# Altium schematic sheet Power_Switch.SchDoc: Power_Switch
size A3; Organization: Altium Limited; Address1: L3, 12a Rodborough Rd; Address2: Frenchs Forest; Address3: NSW; Address4: Australia 2086
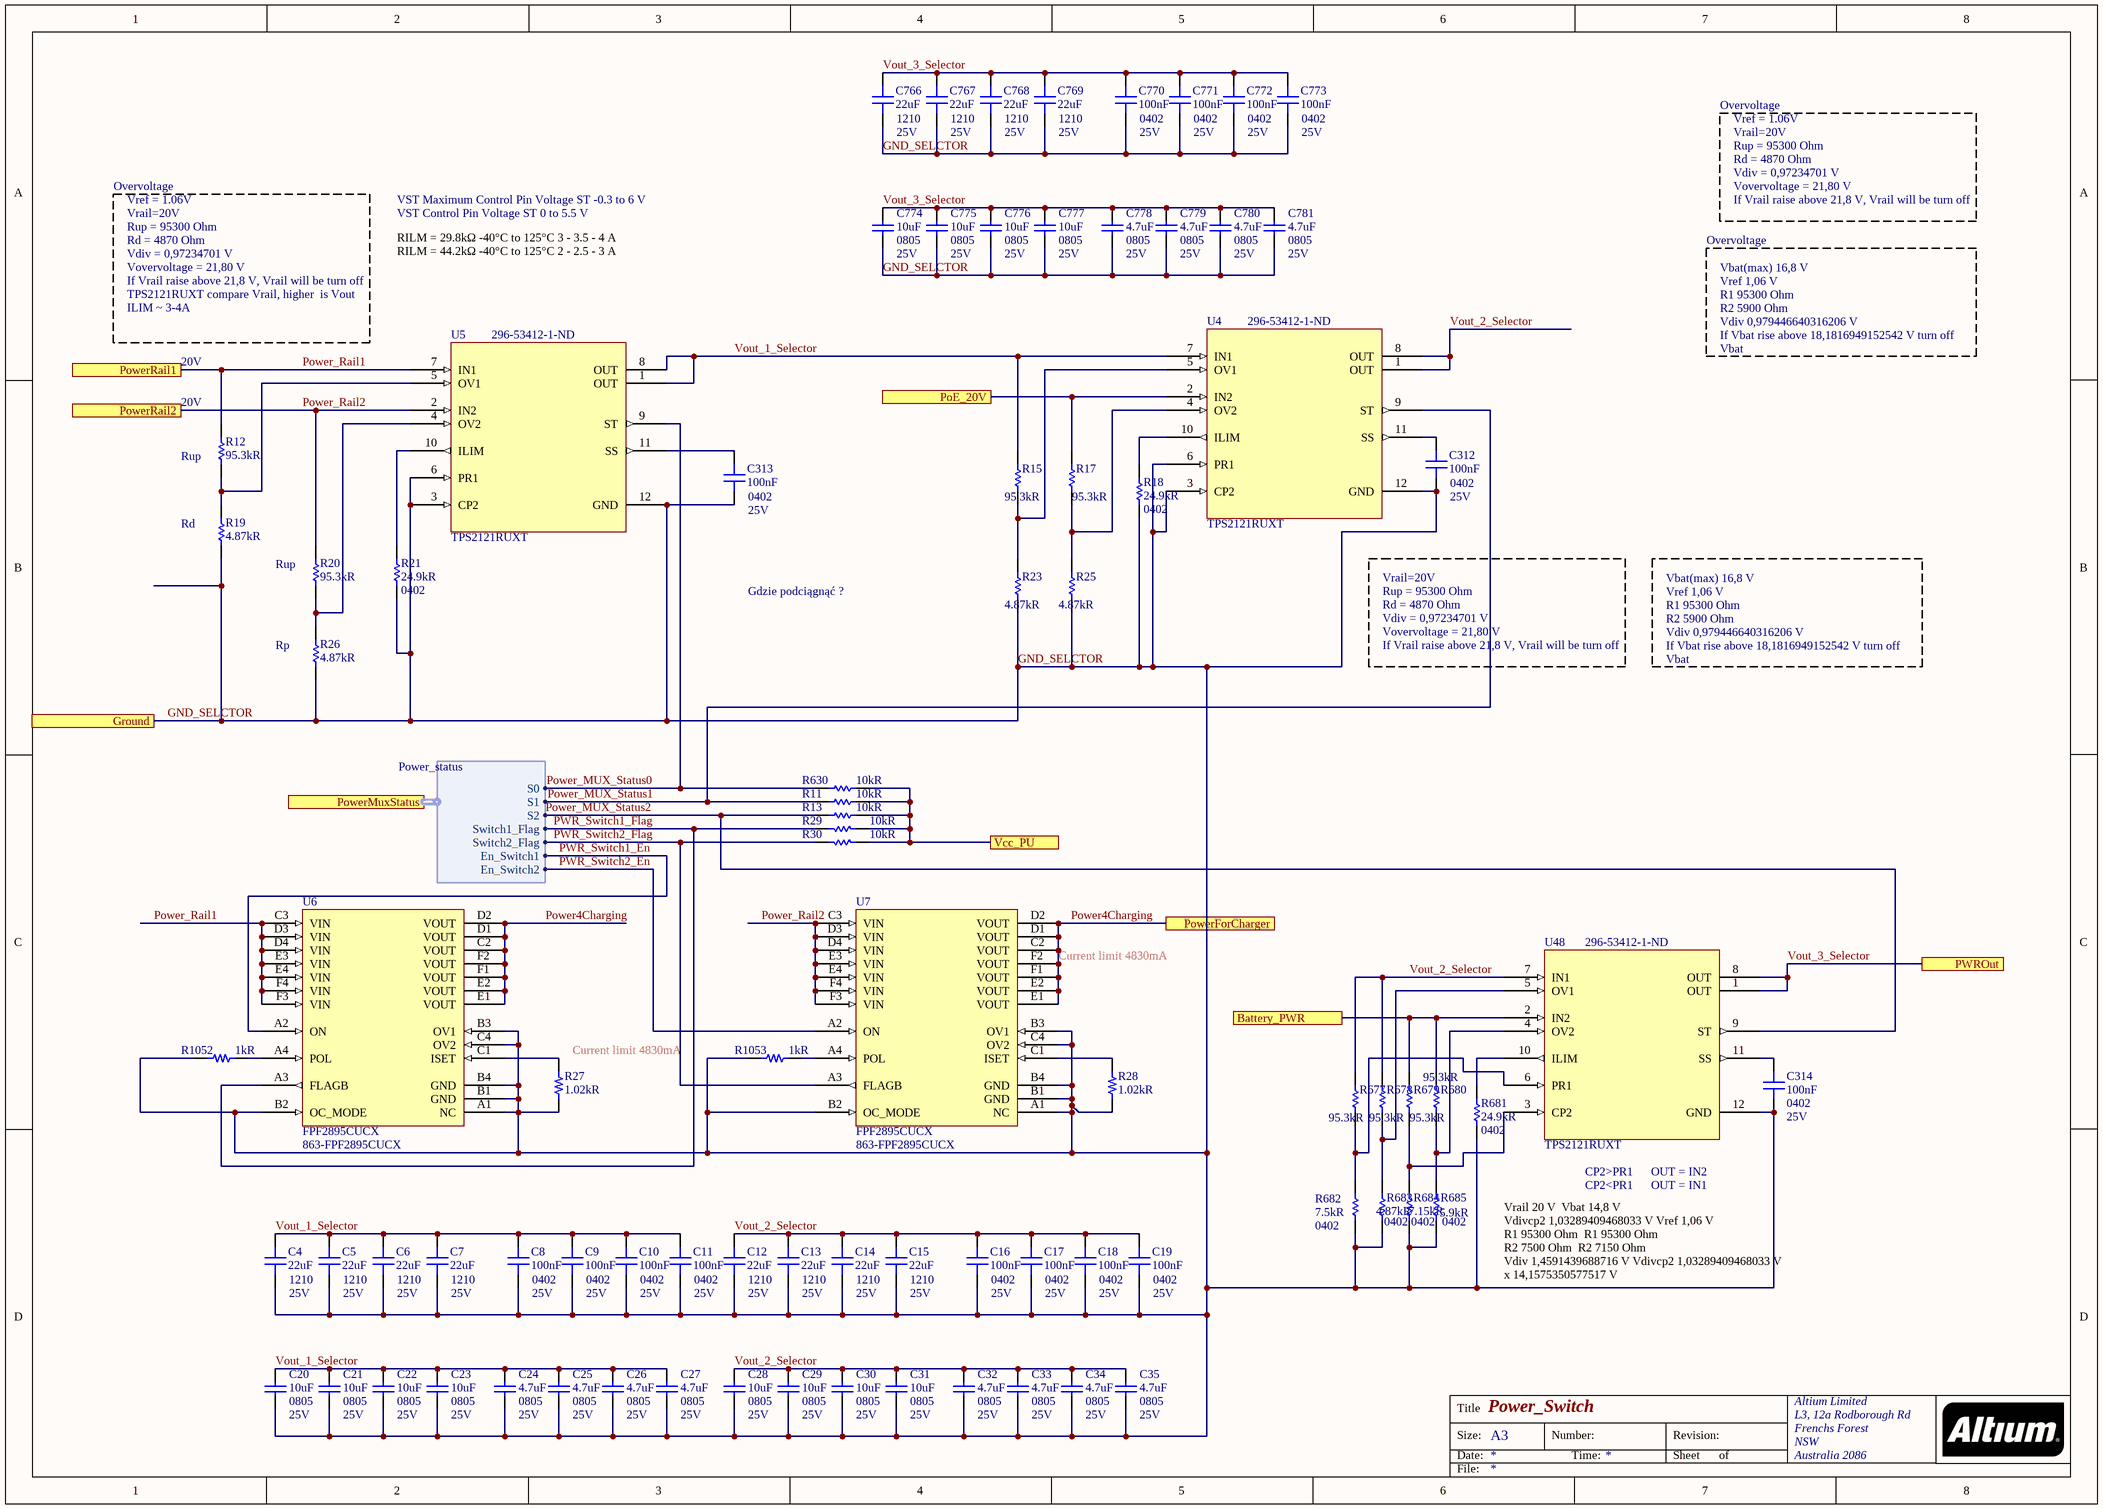
[diagram p0: Power_Switch.SchDoc]

## Parts
C4  22uF  Case/Package: 1210  Voltage Rating: 25V  [CAP 1210/3225 - 1MM]
C5  22uF  Case/Package: 1210  Voltage Rating: 25V  [CAP 1210/3225 - 1MM]
C6  22uF  Case/Package: 1210  Voltage Rating: 25V  [CAP 1210/3225 - 1MM]
C7  22uF  Case/Package: 1210  Voltage Rating: 25V  [CAP 1210/3225 - 1MM]
C8  100nF  Case/Package: 0402  Voltage Rating: 25V  [CAP 0402/1005 KK]
C9  100nF  Case/Package: 0402  Voltage Rating: 25V  [CAP 0402/1005 KK]
C10  100nF  Case/Package: 0402  Voltage Rating: 25V  [CAP 0402/1005 KK]
C11  100nF  Case/Package: 0402  Voltage Rating: 25V  [CAP 0402/1005 KK]
C12  22uF  Case/Package: 1210  Voltage Rating: 25V  [CAP 1210/3225 - 1MM]
C13  22uF  Case/Package: 1210  Voltage Rating: 25V  [CAP 1210/3225 - 1MM]
C14  22uF  Case/Package: 1210  Voltage Rating: 25V  [CAP 1210/3225 - 1MM]
C15  22uF  Case/Package: 1210  Voltage Rating: 25V  [CAP 1210/3225 - 1MM]
C16  100nF  Case/Package: 0402  Voltage Rating: 25V  [CAP 0402/1005 KK]
C17  100nF  Case/Package: 0402  Voltage Rating: 25V  [CAP 0402/1005 KK]
C18  100nF  Case/Package: 0402  Voltage Rating: 25V  [CAP 0402/1005 KK]
C19  100nF  Case/Package: 0402  Voltage Rating: 25V  [CAP 0402/1005 KK]
C20  10uF  Case/Package: 0805  Voltage Rating: 25V  [CAP 0805/2012 RF]
C21  10uF  Case/Package: 0805  Voltage Rating: 25V  [CAP 0805/2012 RF]
C22  10uF  Case/Package: 0805  Voltage Rating: 25V  [CAP 0805/2012 RF]
C23  10uF  Case/Package: 0805  Voltage Rating: 25V  [CAP 0805/2012 RF]
C24  4.7uF  Case/Package: 0805  Voltage Rating: 25V  [CAP 0805/2012 RF]
C25  4.7uF  Case/Package: 0805  Voltage Rating: 25V  [CAP 0805/2012 RF]
C26  4.7uF  Case/Package: 0805  Voltage Rating: 25V  [CAP 0805/2012 RF]
C27  4.7uF  Case/Package: 0805  Voltage Rating: 25V  [CAP 0805/2012 RF]
C28  10uF  Case/Package: 0805  Voltage Rating: 25V  [CAP 0805/2012 RF]
C29  10uF  Case/Package: 0805  Voltage Rating: 25V  [CAP 0805/2012 RF]
C30  10uF  Case/Package: 0805  Voltage Rating: 25V  [CAP 0805/2012 RF]
C31  10uF  Case/Package: 0805  Voltage Rating: 25V  [CAP 0805/2012 RF]
C32  4.7uF  Case/Package: 0805  Voltage Rating: 25V  [CAP 0805/2012 RF]
C33  4.7uF  Case/Package: 0805  Voltage Rating: 25V  [CAP 0805/2012 RF]
C34  4.7uF  Case/Package: 0805  Voltage Rating: 25V  [CAP 0805/2012 RF]
C35  4.7uF  Case/Package: 0805  Voltage Rating: 25V  [CAP 0805/2012 RF]
C312  100nF  Case/Package: 0402  Voltage Rating: 25V  [CAP 0402/1005 KK]
C313  100nF  Case/Package: 0402  Voltage Rating: 25V  [CAP 0402/1005 KK]
C314  100nF  Case/Package: 0402  Voltage Rating: 25V  [CAP 0402/1005 KK]
C766  22uF  Case/Package: 1210  Voltage Rating: 25V  [CAP 1210/3225 - 1MM]
C767  22uF  Case/Package: 1210  Voltage Rating: 25V  [CAP 1210/3225 - 1MM]
C768  22uF  Case/Package: 1210  Voltage Rating: 25V  [CAP 1210/3225 - 1MM]
C769  22uF  Case/Package: 1210  Voltage Rating: 25V  [CAP 1210/3225 - 1MM]
C770  100nF  Case/Package: 0402  Voltage Rating: 25V  [CAP 0402/1005 KK]
C771  100nF  Case/Package: 0402  Voltage Rating: 25V  [CAP 0402/1005 KK]
C772  100nF  Case/Package: 0402  Voltage Rating: 25V  [CAP 0402/1005 KK]
C773  100nF  Case/Package: 0402  Voltage Rating: 25V  [CAP 0402/1005 KK]
C774  10uF  Case/Package: 0805  Voltage Rating: 25V  [CAP 0805/2012 RF]
C775  10uF  Case/Package: 0805  Voltage Rating: 25V  [CAP 0805/2012 RF]
C776  10uF  Case/Package: 0805  Voltage Rating: 25V  [CAP 0805/2012 RF]
C777  10uF  Case/Package: 0805  Voltage Rating: 25V  [CAP 0805/2012 RF]
C778  4.7uF  Case/Package: 0805  Voltage Rating: 25V  [CAP 0805/2012 RF]
C779  4.7uF  Case/Package: 0805  Voltage Rating: 25V  [CAP 0805/2012 RF]
C780  4.7uF  Case/Package: 0805  Voltage Rating: 25V  [CAP 0805/2012 RF]
C781  4.7uF  Case/Package: 0805  Voltage Rating: 25V  [CAP 0805/2012 RF]
R11  10kR  [RES 0402/1005 RF KK]
R12  95.3kR  [RES 0402/1005 RF KK]
R13  10kR  [RES 0402/1005 RF KK]
R15  95.3kR  [RES 0402/1005 RF KK]
R17  95.3kR  [RES 0402/1005 RF KK]
R18  24.9kR  Case/Package: 0402  [RES 0402/1005 RF KK]
R19  4.87kR  [RES 0402/1005 RF KK]
R20  95.3kR  [RES 0402/1005 RF KK]
R21  24.9kR  Case/Package: 0402  [RES 0402/1005 RF KK]
R23  4.87kR  [RES 0402/1005 RF KK]
R25  4.87kR  [RES 0402/1005 RF KK]
R26  4.87kR  [RES 0402/1005 RF KK]
R27  1.02kR  [RES 0402/1005 RF KK]
R28  1.02kR  [RES 0402/1005 RF KK]
R29  10kR  [RES 0402/1005 RF KK]
R30  10kR  [RES 0402/1005 RF KK]
R630  10kR  [RES 0402/1005 RF KK]
R677  95.3kR  [RES 0402/1005 RF KK]
R678  95.3kR  [RES 0402/1005 RF KK]
R679  95.3kR  [RES 0402/1005 RF KK]
R680  95.3kR  [RES 0402/1005 RF KK]
R681  24.9kR  Case/Package: 0402  [RES 0402/1005 RF KK]
R682  7.5kR  Case Code (Imperial): 0402  [RES 0402/1005 RF KK]
R683  4.87kR  Case/Package: 0402  [RES 0402/1005 RF KK]
R684  7.15kR  Case/Package: 0402  [RES 0402/1005 RF KK]
R685  5.9kR  Case Code (Imperial): 0402  [RES 0402/1005 RF KK]
R1052  1kR  [RES 0402/1005 RF KK]
R1053  1kR  [RES 0402/1005 RF KK]
U4  TPS2121RUXT  Supplier Part Number 1: 296-53412-1-ND  [TPS212x]
U5  TPS2121RUXT  Supplier Part Number 1: 296-53412-1-ND  [TPS212x]
U6  FPF2895CUCX  Supplier Part Number 1: 863-FPF2895CUCX  [FPF2895C-D]
U7  FPF2895CUCX  Supplier Part Number 1: 863-FPF2895CUCX  [FPF2895C-D]
U48  TPS2121RUXT  Supplier Part Number 1: 296-53412-1-ND  [TPS212x]

## Ports
Battery_PWR, Ground, PoE_20V, PowerForCharger, PowerMuxStatus (harness Power_status), PowerRail1, PowerRail2, PWROut, Vcc_PU

## Harnesses
Power_status: S0, S1, Switch1_Flag, Switch2_Flag, En_Switch1, En_Switch2, S2

## Nets
Battery_PWR: R679.2 R680.2 U48.2(IN2) ; port Battery_PWR
GND_SELCTOR: C4.2 C5.2 C6.2 C7.2 C8.1 C9.1 C10.1 C11.1 C12.2 C13.2 C14.2 C15.2 C16.1 C17.1 C18.1 C19.1 C20.1 C21.1 C22.1 C23.1 C24.1 C25.1 C26.1 C27.1 C28.1 C29.1 C30.1 C31.1 C32.1 C33.1 C34.1 C35.1 C312.1 C313.1 C314.2 C766.2 C767.2 C768.2 C769.2 C770.1 C771.1 C772.1 C773.1 C774.1 C775.1 C776.1 C777.1 C778.1 C779.1 C780.1 C781.1 R18.1 R19.1 R21.1 R23.1 R25.1 R26.1 R27.1 R28.2 R681.1 R682.1 R683.1 R684.1 R685.1 R1052.2 R1053.2 U4.3(CP2) U4.6(PR1) U4.12(GND) U5.3(CP2) U5.6(PR1) U5.12(GND) U6.A1(NC) U6.B1(GND) U6.B2(OC_MODE) U6.B3(OV1) U6.B4(GND) U6.C4(OV2) U7.A1(NC) U7.B1(GND) U7.B2(OC_MODE) U7.B3(OV1) U7.B4(GND) U7.C4(OV2) U48.12(GND) ; port Ground
PoE_20V: R17.2 U4.2(IN2) ; port PoE_20V
Power4Charging: U6.C2(VOUT) U6.D1(VOUT) U6.D2(VOUT) U6.E1(VOUT) U6.E2(VOUT) U6.F1(VOUT) U6.F2(VOUT) U7.C2(VOUT) U7.D1(VOUT) U7.D2(VOUT) U7.E1(VOUT) U7.E2(VOUT) U7.F1(VOUT) U7.F2(VOUT) ; port PowerForCharger
Power_MUX_Status0: R630.2 U5.9(ST) ; port PowerMuxStatus.S0
Power_MUX_Status1: R11.1 U4.9(ST) ; port PowerMuxStatus.S1
Power_MUX_Status2: R13.2 U48.9(ST) ; port PowerMuxStatus.S2
Power_Rail1: R12.2 U5.7(IN1) U6.C3(VIN) U6.D3(VIN) U6.D4(VIN) U6.E3(VIN) U6.E4(VIN) U6.F3(VIN) U6.F4(VIN) ; port PowerRail1
Power_Rail2: R20.2 U5.2(IN2) U7.C3(VIN) U7.D3(VIN) U7.D4(VIN) U7.E3(VIN) U7.E4(VIN) U7.F3(VIN) U7.F4(VIN) ; port PowerRail2
PWR_Switch1_En: U6.A2(ON) ; port PowerMuxStatus.En_Switch1
PWR_Switch1_Flag: R29.1 U6.A3(FLAGB) ; port PowerMuxStatus.Switch1_Flag
PWR_Switch2_En: U7.A2(ON) ; port PowerMuxStatus.En_Switch2
PWR_Switch2_Flag: R30.1 U7.A3(FLAGB) ; port PowerMuxStatus.Switch2_Flag
Vcc_PU: R11.2 R13.1 R29.2 R30.2 R630.1 ; port Vcc_PU
Vout_1_Selector: C4.1 C5.1 C6.1 C7.1 C8.2 C9.2 C10.2 C11.2 C20.2 C21.2 C22.2 C23.2 C24.2 C25.2 C26.2 C27.2 R15.2 U4.7(IN1) U5.1(OUT) U5.8(OUT)
Vout_2_Selector: C12.1 C13.1 C14.1 C15.1 C16.2 C17.2 C18.2 C19.2 C28.2 C29.2 C30.2 C31.2 C32.2 C33.2 C34.2 C35.2 R677.2 R678.2 U4.1(OUT) U4.8(OUT) U48.7(IN1)
Vout_3_Selector: C766.1 C767.1 C768.1 C769.1 C770.2 C771.2 C772.2 C773.2 C774.2 C775.2 C776.2 C777.2 C778.2 C779.2 C780.2 C781.2 U48.1(OUT) U48.8(OUT) ; port PWROut
NetC312_2: C312.2 U4.11(SS)
NetC313_2: C313.2 U5.11(SS)
NetC314_1: C314.1 U48.11(SS)
NetR12_1: R12.1 R19.2 U5.5(OV1)
NetR15_1: R15.1 R23.2 U4.5(OV1)
NetR17_1: R17.1 R25.2 U4.4(OV2)
NetR18_2: R18.2 U4.10(ILIM)
NetR20_1: R20.1 R26.2 U5.4(OV2)
NetR21_2: R21.2 U5.10(ILIM)
NetR27_2: R27.2 U6.C1(ISET)
NetR28_1: R28.1 U7.C1(ISET)
NetR677_1: R677.1 R682.2 U48.6(PR1)
NetR678_1: R678.1 R683.2 U48.5(OV1)
NetR679_1: R679.1 R684.2 U48.3(CP2)
NetR680_1: R680.1 R685.2 U48.4(OV2)
NetR681_2: R681.2 U48.10(ILIM)
NetR1052_1: R1052.1 U6.A4(POL)
NetR1053_1: R1053.1 U7.A4(POL)

## Notes on the sheet
- Overvoltage
- Vref = 1.06V
- Vrail=20V
- Rup = 95300 Ohm
- Rd = 4870 Ohm
- Vdiv = 0,97234701 V
- VST Maximum Control Pin Voltage ST -0.3 to 6 V
- VST Control Pin Voltage ST 0 to 5.5 V
- Vovervoltage = 21,80 V
- If Vrail raise above 21,8 V, Vrail will be turn off
- TPS2121RUXT compare Vrail, higher  is Vout
- ILIM ~ 3-4A
- RILM = 29.8kΩ -40°C to 125°C 3 - 3.5 - 4 A
  RILM = 44.2kΩ -40°C to 125°C 2 - 2.5 - 3 A
- 20V
- Vbat(max)	16,8	V
  Vref	1,06	V
  R1	95300	Ohm
  R2	5900	Ohm
  Vdiv	0,979446640316206	V
  If Vbat rise above 18,1816949152542 V turn off Vbat
- (near R12) 20V
- (near R12) Rup
- (near R19) Rd
- (near R20) Rup
- (near R26) Rp
- Gdzie podciągnąć ?
- (near U7) Current limit 4830mA
- (near R27) Current limit 4830mA
- CP2>PR1      OUT = IN2
- CP2<PR1      OUT = IN1
- Vrail	20	V		Vbat	14,8	V
  Vdivcp2	1,03289409468033	V	Vref	1,06	V
  R1	95300	Ohm		R1	95300	Ohm
  R2	7500	Ohm		R2	7150	Ohm
  Vdiv	1,4591439688716	V	Vdivcp2	1,03289409468033	V
  x	14,1575350577517	V
- Title
- Size:
- Date:
- A3
- Number:
- Time:
- Revision:
- Sheet
- of
- File:

## Library data of the parts
C4-C7 C12-C15 C766-C769 = Capacitor: Manufacturer: Samsung; Manufacturer Part Number: CL32A226KAJNNNE; Material: Ceramic; Tolerance: 10%; Dielectric: X5R; Supplier 1: Digi-Key; Supplier Part Number 1: 1276-1101-1-ND; Stock 1: 46396; Pricing 1: 1 = 0,51000, 10 = 0,36300, 100 = 0,23920, 500 = 0,17722 (USD); RoHS: Yes; Mount: Surface Mount; Case Code (Metric): 3225; Case Code (Imperial): 1210; Contact Plating: Tin; Min Operating Temperature: -55°C; Max Operating Temperature: 85°C; Capacitance: 22uF; Packaging: Tape and Reel; Package Quantity: 1; Voltage: 25V; Length: 3.2mm; Height: 2.5mm; Width: 0.098inch; Thickness: 0.106inch; Depth: 2.5mm; Radiation Hardening: No; ComponentLink1URL: https://datasheet.ciiva.com/26947/getdatasheetpartid-358377-26947025.pdf?src-supplier=Verical; ComponentLink1Description: https://datasheet.ciiva.com/26947/getdatasheetpartid-358377-26947025.pdf?src-supplier=Verical; ComponentLink2URL: https://datasheet.ciiva.com/16202/cl32a226kajnnne-16202745.pdf?src-supplier=Future+Electronics; ComponentLink2Description: https://datasheet.ciiva.com/16202/cl32a226kajnnne-16202745.pdf?src-supplier=Future+Electronics; ComponentLink3URL: https://datasheet.ciiva.com/29241/450711-da-01-en-vs-kondensator-1210-29241799.pdf?src-supplier=Conrad; ComponentLink3Description: https://datasheet.ciiva.com/29241/450711-da-01-en-vs-kondensator-1210-29241799.pdf?src-supplier=Conrad
C8-C11 C16-C19 C312-C314 C770-C773 = Capacitor: Manufacturer: Murata; Manufacturer Part Number: GRM155R71E104KE14J; Tolerance: 10%; Dielectric: X7R; Supplier 1: Digi-Key; Supplier Part Number 1: 490-14603-1-ND; Stock 1: 89275; Pricing 1: 1 = 0,10000, 10 = 0,03400, 100 = 0,01520, 500 = 0,01088, 1000 = 0,00855, 2500 = 0,00778, 5000 = 0,00715 (USD); RoHS: Yes; Mount: Surface Mount; Weight: 0.000212oz; Case Code (Imperial): 0402; Case Code (Metric): 1005; Min Operating Temperature: -55°C; Max Operating Temperature: 125°C; Packaging: Tape and Reel; Capacitance: 100nF; Termination: SMD/SMT; Composition: Ceramic; Voltage Rating (DC): 25V; Package Quantity: 50000; Length: 0.039inch; Height: 0.5mm; Width: 0.5mm; Thickness: 0.022inch; ComponentLink1URL: http://www.mouser.com/ds/2/281/c02e-2905.pdf?src-supplier=Mouser; ComponentLink1Description: http://www.mouser.com/ds/2/281/c02e-2905.pdf?src-supplier=Mouser; ComponentLink2URL: http://search.murata.co.jp/Ceramy/image/img/A01X/G101/ENG/GRM155R71E104KE14-01.pdf?src-supplier=Digi-Key; ComponentLink2Description: http://search.murata.co.jp/Ceramy/image/img/A01X/G101/ENG/GRM155R71E104KE14-01.pdf?src-supplier=Digi-Key
C20-C23 C28-C31 C774-C777 = Capacitor: CAP CER 10UF 25V X5R 0805; Manufacturer: KEMET; Manufacturer Part Number: C0805C106K3PACTU; Dielectric Material: Ceramic; Dissipation Factor: 10%; Supplier 1: Digi-Key; Supplier Part Number 1: 399-11939-6-ND; RoHS: Yes; Category: Ceramic Capacitors; Stock 1: 4800; Pricing 1: 1=0,24000, 10=0,16800, 100=0,09510, 500=0,06710, 1000=0,05872 (USD); Mount: Surface Mount; Case Code (Metric): 2012; Case Code (Imperial): 0805; Min Operating Temperature: -55°C; Max Operating Temperature: 85°C; Dielectric: X5R; Packaging: Cut Tape; Voltage: 25V; Termination: Solder; Tolerance: 10%; Voltage Rating (DC): 25V; Capacitance: 10uF; Length: 0.079inch; Height: 1.25mm; Depth: 1.25mm; Width: 0.049inch; Thickness: 0.057inch; REACH SVHC: No SVHC; Lead Free: Lead Free; ComponentLink1URL: http://www.farnell.com/datasheets/2741185.pdf?src-supplier=Farnell; ComponentLink1Description: http://www.farnell.com/datasheets/2741185.pdf?src-supplier=Farnell; ComponentLink2URL: http://www.farnell.com/datasheets/2112054.pdf?src-supplier=Farnell; ComponentLink2Description: http://www.farnell.com/datasheets/2112054.pdf?src-supplier=Farnell; ComponentLink3URL: http://www.alliedelec.com/m/d/f3c02ddb98afa3dd1adcb801109671e9.pdf?src-supplier=Allied+Electronics; ComponentLink3Description: http://www.alliedelec.com/m/d/f3c02ddb98afa3dd1adcb801109671e9.pdf?src-supplier=Allied+Electronics; ComponentLink4URL: http://www.farnell.com/datasheets/2112054.pdf?src-supplier=Element14; ComponentLink4Description: http://www.farnell.com/datasheets/2112054.pdf?src-supplier=Element14; ComponentLink5URL: https://api.kemet.com/component-edge/download/datasheet/C0805C106K3PAC7800.pdf?src-supplier=Digi-Key; ComponentLink5Description: https://api.kemet.com/component-edge/download/datasheet/C0805C106K3PAC7800.pdf?src-supplier=Digi-Key; ComponentLink6URL: http://www.kemet.com/docfinder?Partnumber=C0805C106K3PAC7800&src-supplier=Digi-Key; ComponentLink6Description: http://www.kemet.com/docfinder?Partnumber=C0805C106K3PAC7800&src-supplier=Digi-Key; ComponentLink7URL: http://www.kemet.com/Lists/ProductCatalog/Attachments/19/KEM_C1006_X5R_SMD.pdf?src-supplier=Avnet; ComponentLink7Description: http://www.kemet.com/Lists/ProductCatalog/Attachments/19/KEM_C1006_X5R_SMD.pdf?src-supplier=Avnet
C24-C27 C32-C35 C778-C781 = Capacitor: CAP CER 4.7UF 25V X5R 0805; Manufacturer: Murata; Manufacturer Part Number: GRM219R61E475KA73D; Material: Ceramic; Tolerance: 10%; Supplier 1: Digi-Key; Supplier Part Number 1: 490-12753-1-ND; RoHS: Yes; Category: Ceramic Capacitors; Stock 1: 21355; Pricing 1: 1=0,30000, 10=0,20500, 100=0,11610, 500=0,08198, 1000=0,07173 (USD); Mount: Surface Mount; Weight: 0.000335oz; Case Code (Metric): 2012; Case Code (Imperial): 0805; Min Operating Temperature: -55°C; Max Operating Temperature: 85°C; Dielectric: X5R; Capacitance: 4.7uF; Packaging: Tape and Reel; Termination: SMD/SMT; Composition: Ceramic; Voltage Rating (DC): 25V; Package Quantity: 4000; Length: 2mm; Height: 0.85mm; Width: 1.25mm; Thickness: 0.037inch; ComponentLink1URL: http://www.mouser.com/ds/2/281/c02e-2905.pdf?src-supplier=Mouser; ComponentLink1Description: http://www.mouser.com/ds/2/281/c02e-2905.pdf?src-supplier=Mouser; ComponentLink2URL: http://search.murata.co.jp/Ceramy/image/img/A01X/partnumbering_e_01.pdf?src-supplier=Digi-Key; ComponentLink2Description: http://search.murata.co.jp/Ceramy/image/img/A01X/partnumbering_e_01.pdf?src-supplier=Digi-Key; ComponentLink3URL: http://search.murata.co.jp/Ceramy/image/img/A01X/G101/ENG/GRM219R61E475KA73-01.pdf?src-supplier=Digi-Key; ComponentLink3Description: http://search.murata.co.jp/Ceramy/image/img/A01X/G101/ENG/GRM219R61E475KA73-01.pdf?src-supplier=Digi-Key
R11 R13 R29 R30 R630 = Resistor: Manufacturer 1: Yageo; Manufacturer Part Number 1: RC0402FR-0710KL; Tolerance: 1%; Temperature Coefficient: 100ppm/°C; Voltage Rating: 50V; Power Rating: 62.5mW; Supplier 1: Digi-Key; Supplier Part Number 1: 311-10.0KLRCT-ND; Stock 1: 71214322; Pricing 1: 1=0,10000, 10=0,01500, 100=0,00600, 1000=0,00270, 2500=0,00235, 5000=0,00194 (USD); RoHS: Yes; Case/Package: 0402; Number of Pins: 2; Case Code (Imperial): 0402; Case Code (Metric): 1005; Min Operating Temperature: -55°C; Max Operating Temperature: 155°C; Resistance: 10kR; Packaging: Tape and Reel; Composition: Thick Film; Voltage Rating (DC): 50V; Termination: SMD/SMT; Military Standard: Not; Working Voltage: 50V; Number of Terminations: 2; Length: 1mm; Height: 0.32mm; Width: 0.5mm; Depth: 0.5mm; Lead Pitch: 0.2mm; REACH SVHC: No SVHC; Lead Free: Lead Free; ComponentLink1URL: https://datasheet.ciiva.com/7660/38568-7660787.pdf?src-supplier=Element14; ComponentLink1Description: https://datasheet.ciiva.com/7660/38568-7660787.pdf?src-supplier=Element14; ComponentLink2URL: https://datasheet.ciiva.com/7849/1784430-7849813.pdf?src-supplier=Element14; ComponentLink2Description: https://datasheet.ciiva.com/7849/1784430-7849813.pdf?src-supplier=Element14; ComponentLink3URL: https://datasheet.ciiva.com/7849/1686128-7849814.pdf?src-supplier=Element14; ComponentLink3Description: https://datasheet.ciiva.com/7849/1686128-7849814.pdf?src-supplier=Element14; ComponentLink4URL: https://datasheet.ciiva.com/7849/1784430-7849815.pdf?src-supplier=Element14; ComponentLink4Description: https://datasheet.ciiva.com/7849/1784430-7849815.pdf?src-supplier=Element14; ComponentLink5URL: https://datasheet.ciiva.com/22747/1018594-22747512.pdf?src-supplier=Element14; ComponentLink5Description: https://datasheet.ciiva.com/22747/1018594-22747512.pdf?src-supplier=Element14; ComponentLink6URL: https://datasheet.ciiva.com/12667/pyu-rc0402-51-rohs-l-6-r-12667067.pdf?src-supplier=Mouser; ComponentLink6Description: https://datasheet.ciiva.com/12667/pyu-rc0402-51-rohs-l-6-r-12667067.pdf?src-supplier=Mouser; ComponentLink7URL: https://datasheet.ciiva.com/7983/1018594-7983486.pdf?src-supplier=Element14; ComponentLink7Description: https://datasheet.ciiva.com/7983/1018594-7983486.pdf?src-supplier=Element14
R12 R15 R17 R20 R677-R680 = Resistor: Manufacturer 1: Yageo; Manufacturer Part Number 1: RC0402FR-0795K3L; Tolerance: 1%; Voltage Rating (DC): 50V; Power Rating: 62.5mW; Temperature Coefficient: 100ppm/°C; Max Power Dissipation: 63mW; Supplier 1: Digi-Key; Supplier Part Number 1: 311-95.3KLRCT-ND; Stock 1: 128730; Pricing 1: 1=0,10000, 10=0,01600, 100=0,00640, 1000=0,00289, 2500=0,00251, 5000=0,00207 (USD); RoHS: Yes; Case/Package: 0402; Case Code (Imperial): 0402; Case Code (Metric): 1005; Contact Plating: Tin,Matte; Min Operating Temperature: -55°C; Max Operating Temperature: 155°C; Resistance: 95.3kR; Packaging: Tape and Reel; Voltage Rating: 50V; Package Quantity: 1; Termination: SMD/SMT; Composition: Thick Film; Military Standard: Not; Features: Moisture Resistant; Number of Terminations: 2; Length: 0.039inch; Height: 0.016inch; Width: 0.02inch; Depth: 0.5mm; Lead Free: Lead Free; ComponentLink1URL: https://datasheet.ciiva.com/2453/pyu-r-int-thick-7-2453484.pdf?src-supplier=Digi-Key; ComponentLink1Description: https://datasheet.ciiva.com/2453/pyu-r-int-thick-7-2453484.pdf?src-supplier=Digi-Key; ComponentLink2URL: https://datasheet.ciiva.com/28395/pyu-rc0402-51-rohs-l-6-28395740.pdf?src-supplier=Avnet+Europe; ComponentLink2Description: https://datasheet.ciiva.com/28395/pyu-rc0402-51-rohs-l-6-28395740.pdf?src-supplier=Avnet+Europe; ComponentLink3URL: https://datasheet.ciiva.com/2453/pyu-r-int-thick-7-2453485.pdf?src-supplier=Digi-Key; ComponentLink3Description: https://datasheet.ciiva.com/2453/pyu-r-int-thick-7-2453485.pdf?src-supplier=Digi-Key; ComponentLink4URL: https://datasheet.ciiva.com/2453/pyu-r-int-thick-7-2453486.pdf?src-supplier=Digi-Key; ComponentLink4Description: https://datasheet.ciiva.com/2453/pyu-r-int-thick-7-2453486.pdf?src-supplier=Digi-Key; ComponentLink5URL: https://datasheet.ciiva.com/16746/pyu-rc0402-51-rohs-l-6-r-16746015.pdf?src-supplier=Future+Electronics; ComponentLink5Description: https://datasheet.ciiva.com/16746/pyu-rc0402-51-rohs-l-6-r-16746015.pdf?src-supplier=Future+Electronics
R18 R21 R681 = Resistor: RES SMD 24.9KOHM 0.1% 1/16W 0402; Manufacturer: Panasonic; Manufacturer Part Number: ERA-2AEB2492X; Power Rating: 63mW; Voltage Rating: 25V; Temperature Coefficient: 25ppm/°C; Voltage Rating (DC): 50V; Supplier 1: Digi-Key; Supplier Part Number 1: P24.9KDCCT-ND; RoHS: Yes; Category: Chip SMD Resistors; Stock 1: 58145; Pricing 1: 1=0,45000, 10=0,32100, 100=0,12830, 1000=0,06322, 2500=0,05858, 5000=0,05300 (USD); Mount: Surface Mount; Case Code (Metric): 1005; Case Code (Imperial): 0402; Contact Plating: Tin; Min Operating Temperature: -55°C; Max Operating Temperature: 155°C; Resistance: 24.9kR; Packaging: Tape and Reel; Tolerance: 0.1%; Package Quantity: 1; Composition: Thin Film,Metal Film; Number of Terminations: 2; Military Standard: Not; Max Power Dissipation: 63mW; Features: Automotive AEC-Q200; Termination: Wraparound; Length: 1mm; Height: 0.016inch; Width: 0.02inch; Depth: 0.5mm; REACH SVHC: Unknown; Lead Free: Lead Free; ComponentLink1URL: http://www.farnell.com/datasheets/2052875.pdf?src-supplier=Farnell; ComponentLink1Description: http://www.farnell.com/datasheets/2052875.pdf?src-supplier=Farnell; ComponentLink2URL: http://components.arrow.com/part/dataview/0323_02931773?src-supplier=Arrow+Europe; ComponentLink2Description: http://components.arrow.com/part/dataview/0323_02931773?src-supplier=Arrow+Europe; ComponentLink3URL: http://www.mouser.com/ds/2/315/AOA0000C237-1100991.pdf?src-supplier=Mouser; ComponentLink3Description: http://www.mouser.com/ds/2/315/AOA0000C237-1100991.pdf?src-supplier=Mouser; ComponentLink4URL: http://industrial.panasonic.com/www-data/pdf/AOA0000/AOA0000CE26.pdf?src-supplier=Avnet+Asia; ComponentLink4Description: http://industrial.panasonic.com/www-data/pdf/AOA0000/AOA0000CE26.pdf?src-supplier=Avnet+Asia; ComponentLink5URL: http://www.onlinecomponents.com/datasheet/era-2aeb2492x.aspx?p=44473673&src-supplier=Onlinecomponents.com; ComponentLink5Description: http://www.onlinecomponents.com/datasheet/era-2aeb2492x.aspx?p=44473673&src-supplier=Onlinecomponents.com; ComponentLink6URL: https://industrial.panasonic.com/cdbs/www-data/pdf/RDM0000/AOA0000C307.pdf?src-supplier=Digi-Key; ComponentLink6Description: https://industrial.panasonic.com/cdbs/www-data/pdf/RDM0000/AOA0000C307.pdf?src-supplier=Digi-Key; ComponentLink7URL: http://www.farnell.com/datasheets/2052875.pdf?src-supplier=Newark; ComponentLink7Description: http://www.farnell.com/datasheets/2052875.pdf?src-supplier=Newark; ComponentLink8URL: http://www.farnell.com/datasheets/1818319.pdf?src-supplier=Element14; ComponentLink8Description: http://www.farnell.com/datasheets/1818319.pdf?src-supplier=Element14
R19 R23 R25 R26 R683 = Resistor: Manufacturer 1: Yageo; Manufacturer Part Number 1: RC0402FR-074K87L; Power Rating: 62.5mW; Tolerance: 1%; Voltage Rating: 50V; Temperature Coefficient: 100ppm/°C; Max Power Dissipation: 63mW; Supplier 1: Digi-Key; Supplier Part Number 1: YAG3175CT-ND; Stock 1: 130432; Pricing 1: 1=0,10000, 10=0,01600, 100=0,00640, 1000=0,00289, 2500=0,00251, 5000=0,00207 (USD); RoHS: Yes; Case Code (Imperial): 0402; Case Code (Metric): 1005; Contact Plating: Tin,Matte,Lead; Min Operating Temperature: -55°C; Max Operating Temperature: 155°C; Packaging: Tape and Reel; Resistance: 4.87kR; Composition: Thick Film; Termination: SMD/SMT; Number of Terminations: 2; Military Standard: Not; Voltage Rating (DC): 50V; Features: Moisture Resistant; Length: 1mm; Height: 0.016inch; Width: 0.5mm; Depth: 0.5mm; Radiation Hardening: No; Lead Free: Lead Free; ComponentLink1URL: https://datasheet.ciiva.com/16867/pyu-rc0402-51-rohs-l-6-16867671.pdf?src-supplier=Avnet+Europe; ComponentLink1Description: https://datasheet.ciiva.com/16867/pyu-rc0402-51-rohs-l-6-16867671.pdf?src-supplier=Avnet+Europe; ComponentLink2URL: https://datasheet.ciiva.com/17013/pyu-rc0402-51-rohs-l-6-r-17013831.pdf?src-supplier=Future+Electronics; ComponentLink2Description: https://datasheet.ciiva.com/17013/pyu-rc0402-51-rohs-l-6-r-17013831.pdf?src-supplier=Future+Electronics; ComponentLink3URL: https://datasheet.ciiva.com/8892/pyu-rc0402-51-rohs-l-6-8892856.pdf?src-supplier=Avnet; ComponentLink3Description: https://datasheet.ciiva.com/8892/pyu-rc0402-51-rohs-l-6-8892856.pdf?src-supplier=Avnet; ComponentLink4URL: https://datasheet.ciiva.com/28409/pyu-rc0402-51-rohs-l-6-28409851.pdf?src-supplier=Avnet+Europe; ComponentLink4Description: https://datasheet.ciiva.com/28409/pyu-rc0402-51-rohs-l-6-28409851.pdf?src-supplier=Avnet+Europe
  R19 R23 R25 R26: Case/Package: 0402
R27 R28 = Resistor: Manufacturer: Panasonic; Manufacturer Part Number: ERJ-2RKF1021X; Tolerance: 1%; Temperature Coefficient: 100ppm/°C; Power Rating: 100mW; Voltage Rating: 50V; Supplier 1: Digi-Key; Supplier Part Number 1: P1.02KLCT-ND; Stock 1: 88589; Pricing 1: 1 = 0,10000, 10 = 0,04300, 100 = 0,01750, 1000 = 0,00787, 2500 = 0,00683, 5000 = 0,00564 (USD); RoHS: Yes; Mount: Surface Mount; Case/Package: 0402; Case Code (Metric): 1005; Case Code (Imperial): 0402; Contact Plating: Tin; Min Operating Temperature: -55°C; Max Operating Temperature: 155°C; Resistance: 1.02kR; Packaging: Tape and Reel; Composition: Thick Film; Number of Terminations: 2; Voltage Rating (DC): 50V; Max Power Dissipation: 100mW; Features: Automotive AEC-Q200; Package Quantity: 1; Termination: SMD/SMT; Military Standard: Not; Length: 1mm; Height: 0.35mm; Width: 0.02inch; Depth: 0.5mm; REACH SVHC: No SVHC; Lead Free: Lead Free; ComponentLink1URL: https://datasheet.ciiva.com/16760/70260748-16760677.pdf?src-supplier=Allied+Electronics; ComponentLink1Description: https://datasheet.ciiva.com/16760/70260748-16760677.pdf?src-supplier=Allied+Electronics; ComponentLink2URL: https://datasheet.ciiva.com/24026/aoa0000ce2-24026598.pdf?src-supplier=Mouser; ComponentLink2Description: https://datasheet.ciiva.com/24026/aoa0000ce2-24026598.pdf?src-supplier=Mouser; ComponentLink3URL: https://datasheet.ciiva.com/22743/1678782-22743480.pdf?src-supplier=Farnell; ComponentLink3Description: https://datasheet.ciiva.com/22743/1678782-22743480.pdf?src-supplier=Farnell; ComponentLink4URL: https://datasheet.ciiva.com/16778/70260748-16778748.pdf?src-supplier=Allied+Electronics; ComponentLink4Description: https://datasheet.ciiva.com/16778/70260748-16778748.pdf?src-supplier=Allied+Electronics; ComponentLink5URL: https://datasheet.ciiva.com/22682/1678782-22682413.pdf?src-supplier=Element14; ComponentLink5Description: https://datasheet.ciiva.com/22682/1678782-22682413.pdf?src-supplier=Element14; ComponentLink6URL: https://datasheet.ciiva.com/46373/1678782-46373838.pdf?src-supplier=Element14; ComponentLink6Description: https://datasheet.ciiva.com/46373/1678782-46373838.pdf?src-supplier=Element14; ComponentLink7URL: https://datasheet.ciiva.com/46373/1678782-46373839.pdf?src-supplier=Element14; ComponentLink7Description: https://datasheet.ciiva.com/46373/1678782-46373839.pdf?src-supplier=Element14
R682 = Resistor: RES SMD 7.5K OHM 0.5% 1/16W 0402; Manufacturer: Susumu; Manufacturer Part Number: RR0510P-752-D; Power Rating: 62.5mW; Voltage Rating: 25V; Max Power Dissipation: 63mW; Temperature Coefficient: 25ppm/°C; Voltage Rating (DC): 50V; Supplier 1: Digi-Key; Supplier Part Number 1: RR05P7.5KDCT-ND; RoHS: Yes; Category: Chip SMD Resistors; Stock 1: 33319; Pricing 1: 1=0,10000, 10=0,07400, 100=0,02850, 1000=0,01254, 2500=0,01083, 5000=0,00969 (USD); Case/Package: 0402; Case Code (Metric): 1005; Min Operating Temperature: -55°C; Max Operating Temperature: 125°C; Package Quantity: 1; Resistance: 7.5kR; Tolerance: 0.5%; Packaging: Tape and Reel; Composition: Thin Film; Number of Terminations: 2; Termination: SMD/SMT; Length: 0.039inch; Height: 0.016inch; Width: 0.02inch; Lead Free: Lead Free; ComponentLink1URL: https://datasheet.ciiva.com/2525/rr-data-sheet-2525152.pdf?src-supplier=Digi-Key; ComponentLink1Description: https://datasheet.ciiva.com/2525/rr-data-sheet-2525152.pdf?src-supplier=Digi-Key; ComponentLink2URL: https://datasheet.ciiva.com/2525/rr-data-sheet-2525153.pdf?src-supplier=Digi-Key; ComponentLink2Description: https://datasheet.ciiva.com/2525/rr-data-sheet-2525153.pdf?src-supplier=Digi-Key; ComponentLink3URL: https://datasheet.ciiva.com/2525/rr-data-sheet-2525154.pdf?src-supplier=Digi-Key; ComponentLink3Description: https://datasheet.ciiva.com/2525/rr-data-sheet-2525154.pdf?src-supplier=Digi-Key
R684 = Resistor: Manufacturer 1: Yageo; Manufacturer Part Number 1: RC0402FR-077K15L; Tolerance: 1%; Power Rating: 62.5mW; Voltage Rating: 50V; Temperature Coefficient: 100ppm/°C; Max Power Dissipation: 63mW; Supplier 1: Digi-Key; Supplier Part Number 1: YAG3235CT-ND; Stock 1: 134068; Pricing 1: 1=0,10000, 10=0,01600, 100=0,00640, 1000=0,00289, 2500=0,00251, 5000=0,00207 (USD); RoHS: Yes; Case Code (Imperial): 0402; Case Code (Metric): 1005; Contact Plating: Tin,Matte; Min Operating Temperature: -55°C; Max Operating Temperature: 155°C; Resistance: 7.15kR; Packaging: Tape and Reel; Composition: Thick Film; Number of Terminations: 2; Termination: SMD/SMT; Military Standard: Not; Features: Moisture Resistant; Length: 1mm; Height: 0.016inch; Width: 0.02inch; Depth: 0.5mm; Lead Free: Lead Free; ComponentLink1URL: https://datasheet.ciiva.com/28407/pyu-rc0402-51-rohs-l-6-28407927.pdf?src-supplier=Avnet+Europe; ComponentLink1Description: https://datasheet.ciiva.com/28407/pyu-rc0402-51-rohs-l-6-28407927.pdf?src-supplier=Avnet+Europe; ComponentLink2URL: https://datasheet.ciiva.com/8892/pyu-rc0402-51-rohs-l-6-8892025.pdf?src-supplier=Avnet; ComponentLink2Description: https://datasheet.ciiva.com/8892/pyu-rc0402-51-rohs-l-6-8892025.pdf?src-supplier=Avnet; ComponentLink3URL: https://datasheet.ciiva.com/17423/pyu-rc0402-51-rohs-l-6-r-17423802.pdf?src-supplier=Future+Electronics; ComponentLink3Description: https://datasheet.ciiva.com/17423/pyu-rc0402-51-rohs-l-6-r-17423802.pdf?src-supplier=Future+Electronics
R685 = Resistor: Manufacturer: Stackpole Electronics; Manufacturer Part Number: RMCF0402FT5K90; Tolerance: 1%; Max Power Dissipation: 63mW; Temperature Coefficient: 100ppm/°C; Supplier 1: Digi-Key; Supplier Part Number 1: RMCF0402FT5K90CT-ND; Stock 1: 22990; Pricing 1: 1 = 0,10000, 10 = 0,01400, 100 = 0,00580, 1000 = 0,00262, 2500 = 0,00228, 5000 = 0,00188 (USD); RoHS: Yes; Mount: Surface Mount; Case/Package: 0402; Case Code (Metric): 1005; Contact Plating: Tin,Matte; Min Operating Temperature: -55°C; Max Operating Temperature: 155°C; Resistance: 5.9kR; Packaging: Tape and Reel; Composition: Thick Film; Number of Terminations: 2; Features: Automotive AEC-Q200; Length: 0.039inch; Height: 0.016inch; Width: 0.02inch; Radiation Hardening: No; Lead Free: Lead Free; ComponentLink1URL: https://www.seielect.com/Catalog/SEI-RMCF_RMCP.pdf?src-supplier=Digi-Key; ComponentLink1Description: https://www.seielect.com/Catalog/SEI-RMCF_RMCP.pdf?src-supplier=Digi-Key; ComponentLink2URL: https://www.seielect.com/catalog/SEI-Packaging.pdf?src-supplier=Digi-Key; ComponentLink2Description: https://www.seielect.com/catalog/SEI-Packaging.pdf?src-supplier=Digi-Key; ComponentLink3URL: https://www.seielect.com/catalog/SEI-RMCF_RMCP.pdf?src-supplier=Avnet; ComponentLink3Description: https://www.seielect.com/catalog/SEI-RMCF_RMCP.pdf?src-supplier=Avnet
R1052 R1053 = Resistor: Manufacturer: Panasonic; Manufacturer Part Number: ERJ-2RKF1001X; Tolerance: 1%; Power Rating: 100mW; Temperature Coefficient: 100ppm/°C; Voltage Rating: 50V; Supplier 1: Digi-Key; Supplier Part Number 1: P1.00KLCT-ND; Stock 1: 6683975; Pricing 1: 1 = 0,10000, 10 = 0,05200, 100 = 0,02130, 1000 = 0,00958, 2500 = 0,00832, 5000 = 0,00687 (USD); RoHS: Yes; Mount: Surface Mount; Case/Package: 0402; Number of Pins: 2; Case Code (Imperial): 0402; Case Code (Metric): 1005; Contact Plating: Tin; Min Operating Temperature: -55°C; Max Operating Temperature: 155°C; Resistance: 1kR; Packaging: Tape and Reel; Composition: Thick Film; Termination: SMD/SMT; Package Quantity: 1; Military Standard: Not; Number of Terminations: 2; Max Power Dissipation: 100mW; Voltage Rating (DC): 50V; Features: Automotive AEC-Q200; Working Voltage: 50V; Length: 1mm; Height: 0.35mm; Width: 0.5mm; Depth: 0.5mm; Radiation Hardening: No; Lead Free: Lead Free; REACH SVHC: No SVHC; ComponentLink1URL: https://datasheet.ciiva.com/11821/0900766b80f80784-11821203.pdf?src-supplier=RSComponents; ComponentLink1Description: https://datasheet.ciiva.com/11821/0900766b80f80784-11821203.pdf?src-supplier=RSComponents; ComponentLink2URL: https://datasheet.ciiva.com/16767/70260748-16767559.pdf?src-supplier=Allied+Electronics; ComponentLink2Description: https://datasheet.ciiva.com/16767/70260748-16767559.pdf?src-supplier=Allied+Electronics; ComponentLink3URL: https://datasheet.ciiva.com/9198/aoa0000ce2-9198920.pdf?src-supplier=Avnet; ComponentLink3Description: https://datasheet.ciiva.com/9198/aoa0000ce2-9198920.pdf?src-supplier=Avnet; ComponentLink4URL: https://datasheet.ciiva.com/7942/aoa0000ce2-7942426.pdf?src-supplier=Element14; ComponentLink4Description: https://datasheet.ciiva.com/7942/aoa0000ce2-7942426.pdf?src-supplier=Element14; ComponentLink5URL: https://datasheet.ciiva.com/16771/70260748-16771979.pdf?src-supplier=Allied+Electronics; ComponentLink5Description: https://datasheet.ciiva.com/16771/70260748-16771979.pdf?src-supplier=Allied+Electronics; ComponentLink6URL: https://datasheet.ciiva.com/17215/aoa0000ce2-17215308.pdf?src-supplier=Avnet+Europe; ComponentLink6Description: https://datasheet.ciiva.com/17215/aoa0000ce2-17215308.pdf?src-supplier=Avnet+Europe; ComponentLink7URL: https://datasheet.ciiva.com/28532/1678782-28532109.pdf?src-supplier=Element14; ComponentLink7Description: https://datasheet.ciiva.com/28532/1678782-28532109.pdf?src-supplier=Element14; ComponentLink8URL: https://datasheet.ciiva.com/16523/aoa0000ce2-16523834.pdf?src-supplier=Avnet+Asia; ComponentLink8Description: https://datasheet.ciiva.com/16523/aoa0000ce2-16523834.pdf?src-supplier=Avnet+Asia; ComponentLink9URL: https://datasheet.ciiva.com/22673/1678782-22673916.pdf?src-supplier=Element14; ComponentLink9Description: https://datasheet.ciiva.com/22673/1678782-22673916.pdf?src-supplier=Element14
U4 U5 U48 = TPS2121RUXT: Manufacturer 1: Texas Instruments; Supplier 1: Digi-Key; Manufacturer Part Number 1: TPS2121RUXT; Stock 1: 67; Pricing 1: 1=2,46000, 10=2,21100, 100=1,66860 (USD); RoHS: No
  U5: ComponentLink1Description: Datasheet; ComponentLink1URL: http://www.ti.com/lit/ds/symlink/tps2120.pdf
U6 U7 = FPF2895CUCX: Current Limit Load Switch with OVP and TRCB, 28 V, 5 A; Manufacturer 1: ON Semiconductor; Supplier 1: Mouser; Manufacturer Part Number 1: FPF2895CUCX; Stock 1: 808; Pricing 1: 1=2,18000, 10=1,85000, 100=1,48000, 500=1,29000, 1000=1,07000, 3000=1,00000, 6000=0,96500, 9000=0,92800, 24000=0,89200 (USD); RoHS: No